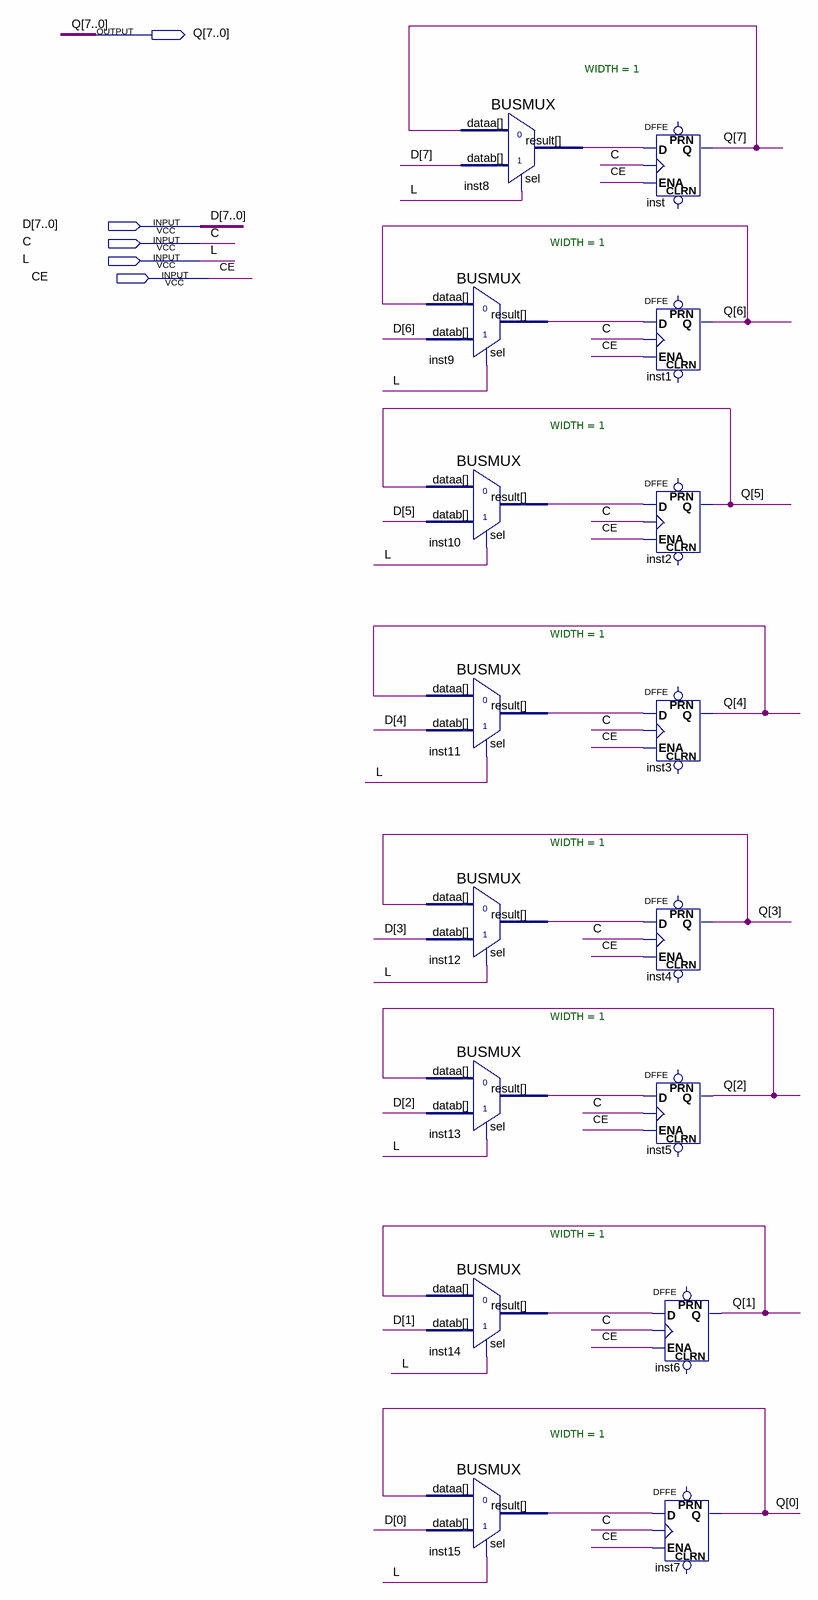
[diagram p0: schematic sheet]
// Quartus schematic ReceivREG.bdf as structural Verilog: 16 symbols, 5 pins
module ReceivREG (
  input  [7:0] D,
  input  C,
  input  L,
  input  CE,
  output [7:0] Q
);

  wire inst8_result, inst9_result, inst10_result, inst11_result, inst12_result, inst13_result, inst14_result,
       inst15_result;

  BUSMUX #(.WIDTH(1)) inst8 (.datab(D[7]), .sel(L), .dataa(Q[7]), .result(inst8_result));
  BUSMUX #(.WIDTH(1)) inst9 (.datab(D[6]), .sel(L), .dataa(Q[6]), .result(inst9_result));
  BUSMUX #(.WIDTH(1)) inst10 (.datab(D[5]), .sel(L), .dataa(Q[5]), .result(inst10_result));
  BUSMUX #(.WIDTH(1)) inst11 (.datab(D[4]), .sel(L), .dataa(Q[4]), .result(inst11_result));
  BUSMUX #(.WIDTH(1)) inst12 (.datab(D[3]), .sel(L), .dataa(Q[3]), .result(inst12_result));
  BUSMUX #(.WIDTH(1)) inst13 (.datab(D[2]), .sel(L), .dataa(Q[2]), .result(inst13_result));
  BUSMUX #(.WIDTH(1)) inst14 (.datab(D[1]), .sel(L), .dataa(Q[1]), .result(inst14_result));
  BUSMUX #(.WIDTH(1)) inst15 (.datab(D[0]), .sel(L), .dataa(Q[0]), .result(inst15_result));
  DFFE inst (.D(inst8_result), .CLK(C), .ENA(CE), .Q(Q[7]));  // open: PRN, CLRN
  DFFE inst1 (.D(inst9_result), .CLK(C), .ENA(CE), .Q(Q[6]));  // open: PRN, CLRN
  DFFE inst2 (.D(inst10_result), .CLK(C), .ENA(CE), .Q(Q[5]));  // open: PRN, CLRN
  DFFE inst3 (.D(inst11_result), .CLK(C), .ENA(CE), .Q(Q[4]));  // open: PRN, CLRN
  DFFE inst4 (.D(inst12_result), .CLK(C), .ENA(CE), .Q(Q[3]));  // open: PRN, CLRN
  DFFE inst5 (.D(inst13_result), .CLK(C), .ENA(CE), .Q(Q[2]));  // open: PRN, CLRN
  DFFE inst6 (.D(inst14_result), .CLK(C), .ENA(CE), .Q(Q[1]));  // open: PRN, CLRN
  DFFE inst7 (.D(inst15_result), .CLK(C), .ENA(CE), .Q(Q[0]));  // open: PRN, CLRN
endmodule
